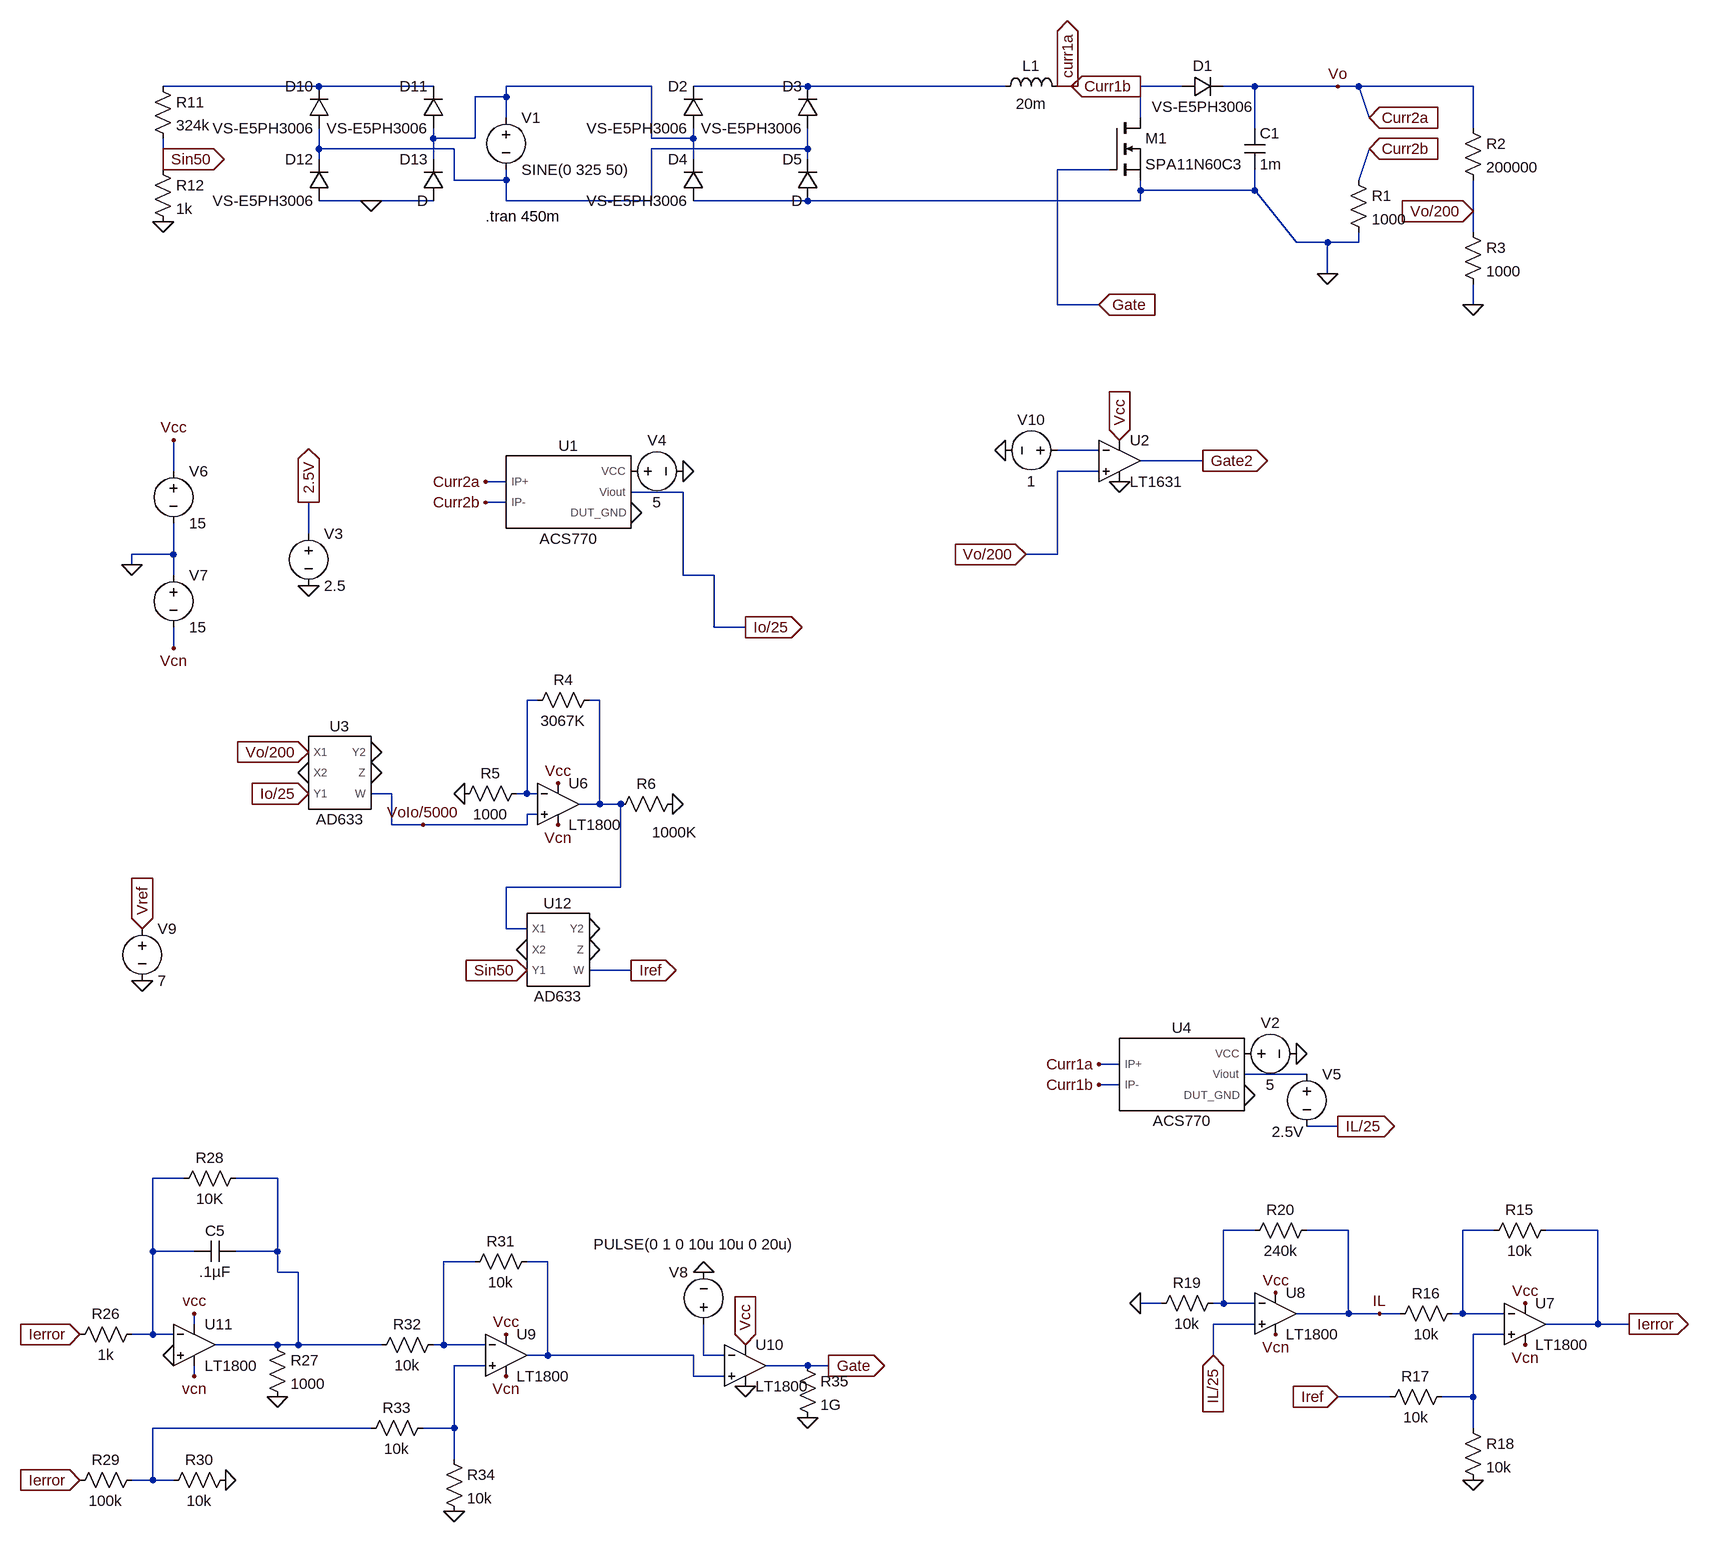
[diagram p0: schematic 6% THD Only current loop.asc]
6% THD Only current loop.asc, the LTspice schematic file:
Version 4.1
SHEET 1 2864 3240
WIRE -672 80 -912 80
WIRE -496 80 -672 80
WIRE -160 80 -384 80
WIRE 80 80 -96 80
WIRE 384 80 80 80
WIRE 480 80 464 80
WIRE 496 80 480 80
WIRE 656 80 592 80
WIRE 768 80 720 80
WIRE 896 80 768 80
WIRE 928 80 896 80
WIRE 1104 80 928 80
WIRE -384 96 -384 80
WIRE -384 96 -432 96
WIRE -384 128 -384 96
WIRE 592 128 592 80
WIRE 944 128 928 80
WIRE 768 144 768 80
WIRE 1104 144 1104 80
WIRE -496 160 -496 144
WIRE -432 160 -432 96
WIRE -432 160 -496 160
WIRE -160 160 -160 80
WIRE -96 160 -96 144
WIRE -96 160 -160 160
WIRE -672 176 -672 144
WIRE -464 176 -672 176
WIRE 80 176 80 144
WIRE 80 176 -160 176
WIRE -912 192 -912 160
WIRE -672 192 -672 176
WIRE -496 192 -496 160
WIRE -96 192 -96 160
WIRE 80 192 80 176
WIRE -912 208 -912 192
WIRE 544 208 464 208
WIRE -464 224 -464 176
WIRE -384 224 -384 208
WIRE -384 224 -464 224
WIRE 928 224 944 176
WIRE 592 240 592 224
WIRE 768 240 768 208
WIRE 768 240 592 240
WIRE -592 256 -672 256
WIRE -496 256 -592 256
WIRE -384 256 -384 224
WIRE -160 256 -160 176
WIRE -160 256 -384 256
WIRE 80 256 -96 256
WIRE 592 256 592 240
WIRE 592 256 80 256
WIRE 1104 272 1104 224
WIRE 1104 304 1104 272
WIRE 832 320 768 240
WIRE 880 320 832 320
WIRE 928 320 928 304
WIRE 928 320 880 320
WIRE 880 368 880 320
WIRE 464 416 464 208
WIRE 528 416 464 416
WIRE 1104 416 1104 384
WIRE 528 640 464 640
WIRE 688 656 592 656
WIRE -896 672 -896 624
WIRE 528 672 464 672
WIRE -384 688 -416 688
WIRE -112 704 -192 704
WIRE -384 720 -416 720
WIRE -688 768 -688 720
WIRE -896 800 -896 752
WIRE -896 800 -960 800
WIRE 464 800 464 672
WIRE 464 800 416 800
WIRE -960 816 -960 800
WIRE -896 832 -896 800
WIRE -112 832 -112 704
WIRE -64 832 -112 832
WIRE -64 912 -64 832
WIRE -16 912 -64 912
WIRE -896 944 -896 912
WIRE -336 1024 -352 1024
WIRE -240 1024 -256 1024
WIRE -560 1168 -592 1168
WIRE -352 1168 -352 1024
WIRE -352 1168 -368 1168
WIRE -336 1168 -352 1168
WIRE -240 1184 -240 1024
WIRE -240 1184 -272 1184
WIRE -208 1184 -240 1184
WIRE -336 1200 -352 1200
WIRE -560 1216 -560 1168
WIRE -512 1216 -560 1216
WIRE -352 1216 -352 1200
WIRE -352 1216 -512 1216
WIRE -208 1312 -208 1184
WIRE -208 1312 -384 1312
WIRE -384 1376 -384 1312
WIRE -352 1376 -384 1376
WIRE -192 1440 -256 1440
WIRE 560 1584 528 1584
WIRE 848 1600 752 1600
WIRE 560 1616 528 1616
WIRE 896 1680 848 1680
WIRE -880 1760 -928 1760
WIRE -736 1760 -800 1760
WIRE 768 1840 720 1840
WIRE 912 1840 848 1840
WIRE 1136 1840 1088 1840
WIRE 1296 1840 1216 1840
WIRE -928 1872 -928 1760
WIRE -864 1872 -928 1872
WIRE -736 1872 -736 1760
WIRE -736 1872 -800 1872
WIRE -432 1888 -480 1888
WIRE -320 1888 -352 1888
WIRE -736 1904 -736 1872
WIRE -704 1904 -736 1904
WIRE 624 1952 592 1952
WIRE 720 1952 720 1840
WIRE 720 1952 704 1952
WIRE 768 1952 720 1952
WIRE 912 1968 912 1840
WIRE 912 1968 832 1968
WIRE 960 1968 912 1968
WIRE 992 1968 960 1968
WIRE 1088 1968 1088 1840
WIRE 1088 1968 1072 1968
WIRE 1152 1968 1088 1968
WIRE -864 1984 -864 1968
WIRE 768 1984 704 1984
WIRE 1296 1984 1296 1840
WIRE 1296 1984 1216 1984
WIRE 1344 1984 1296 1984
WIRE -928 2000 -928 1872
WIRE -928 2000 -960 2000
WIRE -896 2000 -928 2000
WIRE 1152 2000 1104 2000
WIRE -736 2016 -832 2016
WIRE -704 2016 -704 1904
WIRE -704 2016 -736 2016
WIRE -576 2016 -704 2016
WIRE -480 2016 -480 1888
WIRE -480 2016 -496 2016
WIRE -416 2016 -480 2016
WIRE -320 2032 -320 1888
WIRE -320 2032 -352 2032
WIRE -96 2032 -320 2032
WIRE -80 2032 -80 1984
WIRE -48 2032 -80 2032
WIRE 704 2032 704 1984
WIRE -416 2048 -464 2048
WIRE 80 2048 16 2048
WIRE 112 2048 80 2048
WIRE -864 2064 -864 2048
WIRE -96 2064 -96 2032
WIRE -48 2064 -96 2064
WIRE 976 2096 896 2096
WIRE 1104 2096 1104 2000
WIRE 1104 2096 1056 2096
WIRE -592 2144 -928 2144
WIRE -464 2144 -464 2048
WIRE -464 2144 -512 2144
WIRE 1104 2144 1104 2096
WIRE -464 2192 -464 2144
WIRE -928 2224 -928 2144
WIRE -928 2224 -960 2224
WIRE -896 2224 -928 2224
FLAG 1104 416 0
FLAG 1104 272 Vo/200
IOPIN 1104 272 In
FLAG 896 80 Vo
FLAG 480 80 curr1a
IOPIN 480 80 Out
FLAG 592 80 Curr1b
IOPIN 592 80 Out
FLAG 528 1584 Curr1a
FLAG 528 1616 Curr1b
FLAG 832 1568 0
FLAG 752 1632 0
FLAG -416 688 Curr2a
FLAG -416 720 Curr2b
FLAG -112 672 0
FLAG -192 736 0
FLAG 944 128 Curr2a
IOPIN 944 128 In
FLAG 944 176 Curr2b
IOPIN 944 176 In
FLAG -896 944 Vcn
FLAG -896 624 Vcc
FLAG -960 816 0
FLAG 1104 2224 0
FLAG 1184 1952 Vcc
FLAG 1184 2016 Vcn
FLAG 800 1936 Vcc
FLAG 800 2000 Vcn
FLAG 704 2032 IL/25
IOPIN 704 2032 In
FLAG 592 1952 0
FLAG 896 2096 Iref
IOPIN 896 2096 In
FLAG 960 1968 IL
FLAG 1344 1984 Ierror
IOPIN 1344 1984 Out
FLAG -864 1968 vcc
FLAG -864 2064 vcn
FLAG -896 2032 0
FLAG -736 2096 0
FLAG -1040 2000 Ierror
IOPIN -1040 2000 In
FLAG -1040 2224 Ierror
IOPIN -1040 2224 In
FLAG -816 2224 0
FLAG -464 2272 0
FLAG -384 2000 Vcc
FLAG -384 2064 Vcn
FLAG -80 1904 0
FLAG -16 2080 0
FLAG -16 2016 Vcc
IOPIN -16 2016 In
FLAG 112 2048 Gate
IOPIN 112 2048 Out
FLAG 80 2128 0
FLAG 528 416 Gate
IOPIN 528 416 In
FLAG -912 288 0
FLAG -912 192 Sin50
IOPIN -912 192 Out
FLAG -592 256 0
FLAG -688 848 0
FLAG -688 720 2.5V
IOPIN -688 720 Out
FLAG 896 1680 IL/25
IOPIN 896 1680 Out
FLAG -16 912 Io/25
IOPIN -16 912 Out
FLAG -688 1104 Vo/200
IOPIN -688 1104 In
FLAG -688 1168 Io/25
IOPIN -688 1168 In
FLAG -352 1440 Sin50
IOPIN -352 1440 In
FLAG -688 1136 0
FLAG -592 1104 0
FLAG -592 1136 0
FLAG -352 1408 0
FLAG -256 1408 0
FLAG -256 1376 0
FLAG 560 624 Vcc
IOPIN 560 624 In
FLAG -448 1168 0
FLAG -128 1184 0
FLAG -512 1216 VoIo/5000
FLAG -192 1440 Iref
IOPIN -192 1440 Out
FLAG -944 1456 0
FLAG -944 1376 Vref
IOPIN -944 1376 In
FLAG 560 688 0
FLAG 384 640 0
FLAG 416 800 Vo/200
IOPIN 416 800 In
FLAG 880 368 0
FLAG 688 656 Gate2
IOPIN 688 656 Out
FLAG -304 1152 Vcc
FLAG -304 1216 Vcn
SYMBOL ind 368 96 R270
WINDOW 0 32 56 VTop 2
WINDOW 3 5 56 VBottom 2
SYMATTR InstName L1
SYMATTR Value 20m
SYMBOL cap 752 144 R0
SYMATTR InstName C1
SYMATTR Value 1m
SYMBOL nmos 544 128 R0
SYMATTR InstName M1
SYMATTR Value SPA11N60C3
SYMBOL res 912 208 R0
SYMATTR InstName R1
SYMATTR Value 1000
SYMBOL diode 656 96 R270
WINDOW 0 32 32 VTop 2
WINDOW 3 0 32 VBottom 2
SYMATTR InstName D1
SYMATTR Value VS-E5PH3006
SYMBOL diode -80 144 R180
WINDOW 0 24 64 Left 2
WINDOW 3 24 0 Left 2
SYMATTR InstName D2
SYMATTR Value VS-E5PH3006
SYMBOL diode 96 144 R180
WINDOW 0 24 64 Left 2
WINDOW 3 24 0 Left 2
SYMATTR InstName D3
SYMATTR Value VS-E5PH3006
SYMBOL diode -80 256 R180
WINDOW 0 24 64 Left 2
WINDOW 3 24 0 Left 2
SYMATTR InstName D4
SYMATTR Value VS-E5PH3006
SYMBOL diode 96 256 R180
WINDOW 0 24 64 Left 2
WINDOW 3 24 0 Left 2
SYMATTR InstName D5
SYMBOL voltage -384 112 R0
WINDOW 123 0 0 Left 0
WINDOW 39 0 0 Left 0
SYMATTR InstName V1
SYMATTR Value SINE(0 325 50)
SYMBOL res 1088 128 R0
SYMATTR InstName R2
SYMATTR Value 200000
SYMBOL res 1088 288 R0
SYMATTR InstName R3
SYMATTR Value 1000
SYMBOL voltage 736 1568 R270
WINDOW 0 32 56 VTop 2
WINDOW 3 -32 56 VBottom 2
SYMATTR InstName V2
SYMATTR Value 5
SYMBOL voltage -208 672 R270
WINDOW 0 32 56 VTop 2
WINDOW 3 -32 56 VBottom 2
SYMATTR InstName V4
SYMATTR Value 5
SYMBOL voltage -896 656 R0
SYMATTR InstName V6
SYMATTR Value 15
SYMBOL voltage -896 816 R0
SYMATTR InstName V7
SYMATTR Value 15
SYMBOL res 1232 1824 R90
WINDOW 0 0 56 VBottom 2
WINDOW 3 32 56 VTop 2
SYMATTR InstName R15
SYMATTR Value 10k
SYMBOL res 976 1984 R270
WINDOW 0 32 56 VTop 2
WINDOW 3 0 56 VBottom 2
SYMATTR InstName R16
SYMATTR Value 10k
SYMBOL res 960 2112 R270
WINDOW 0 32 56 VTop 2
WINDOW 3 0 56 VBottom 2
SYMATTR InstName R17
SYMATTR Value 10k
SYMBOL res 1088 2128 R0
SYMATTR InstName R18
SYMATTR Value 10k
SYMBOL res 720 1936 R90
WINDOW 0 0 56 VBottom 2
WINDOW 3 32 56 VTop 2
SYMATTR InstName R19
SYMATTR Value 10k
SYMBOL res 864 1824 R90
WINDOW 0 0 56 VBottom 2
WINDOW 3 32 56 VTop 2
SYMATTR InstName R20
SYMATTR Value 240k
SYMBOL res -944 1984 R90
WINDOW 0 0 56 VBottom 2
WINDOW 3 32 56 VTop 2
SYMATTR InstName R26
SYMATTR Value 1k
SYMBOL res -752 2000 R0
SYMATTR InstName R27
SYMATTR Value 1000
SYMBOL cap -800 1856 R90
WINDOW 0 0 32 VBottom 2
WINDOW 3 32 32 VTop 2
SYMATTR InstName C5
SYMATTR Value .1µF
SYMBOL res -784 1744 R90
WINDOW 0 0 56 VBottom 2
WINDOW 3 32 56 VTop 2
SYMATTR InstName R28
SYMATTR Value 10K
SYMBOL res -944 2208 R90
WINDOW 0 0 56 VBottom 2
WINDOW 3 32 56 VTop 2
SYMATTR InstName R29
SYMATTR Value 100k
SYMBOL res -800 2208 R90
WINDOW 0 0 56 VBottom 2
WINDOW 3 32 56 VTop 2
SYMATTR InstName R30
SYMATTR Value 10k
SYMBOL res -336 1872 R90
WINDOW 0 0 56 VBottom 2
WINDOW 3 32 56 VTop 2
SYMATTR InstName R31
SYMATTR Value 10k
SYMBOL res -592 2032 R270
WINDOW 0 32 56 VTop 2
WINDOW 3 0 56 VBottom 2
SYMATTR InstName R32
SYMATTR Value 10k
SYMBOL res -608 2160 R270
WINDOW 0 32 56 VTop 2
WINDOW 3 0 56 VBottom 2
SYMATTR InstName R33
SYMATTR Value 10k
SYMBOL res -480 2176 R0
SYMATTR InstName R34
SYMATTR Value 10k
SYMBOL voltage -80 2000 R180
WINDOW 0 24 96 Left 2
WINDOW 3 -141 139 Left 2
WINDOW 123 0 0 Left 0
WINDOW 39 0 0 Left 0
SYMATTR InstName V8
SYMATTR Value PULSE(0 1 0 10u 10u 0 20u)
SYMBOL res 64 2032 R0
SYMATTR InstName R35
SYMATTR Value 1G
SYMBOL diode -656 144 R180
WINDOW 0 24 64 Left 2
WINDOW 3 24 0 Left 2
SYMATTR InstName D10
SYMATTR Value VS-E5PH3006
SYMBOL diode -480 144 R180
WINDOW 0 24 64 Left 2
WINDOW 3 24 0 Left 2
SYMATTR InstName D11
SYMATTR Value VS-E5PH3006
SYMBOL diode -656 256 R180
WINDOW 0 24 64 Left 2
WINDOW 3 24 0 Left 2
SYMATTR InstName D12
SYMATTR Value VS-E5PH3006
SYMBOL diode -480 256 R180
WINDOW 0 24 64 Left 2
WINDOW 3 24 0 Left 2
SYMATTR InstName D13
SYMBOL res -928 64 R0
SYMATTR InstName R11
SYMATTR Value 324k
SYMBOL res -928 192 R0
SYMATTR InstName R12
SYMATTR Value 1k
SYMBOL voltage -688 752 R0
SYMATTR InstName V3
SYMATTR Value 2.5
SYMBOL OpAmps\\LT1800 -16 1984 R0
SYMATTR InstName U10
SYMBOL OpAmps\\LT1800 1184 1920 R0
SYMATTR InstName U7
SYMBOL OpAmps\\LT1800 800 1904 R0
SYMATTR InstName U8
SYMBOL OpAmps\\LT1800 -384 1968 R0
SYMATTR InstName U9
SYMBOL OpAmps\\LT1800 -864 1952 R0
SYMATTR InstName U11
SYMBOL voltage 848 1584 R0
WINDOW 3 -54 104 Left 2
SYMATTR Value 2.5V
SYMATTR InstName V5
SYMBOL OpAmps\\LT1631 560 592 R0
SYMATTR InstName U2
SYMBOL res -240 1008 R90
WINDOW 0 0 56 VBottom 2
WINDOW 3 32 56 VTop 2
SYMATTR InstName R4
SYMATTR Value 3067K
SYMBOL res -352 1152 R90
WINDOW 0 0 56 VBottom 2
WINDOW 3 32 56 VTop 2
SYMATTR InstName R5
SYMATTR Value 1000
SYMBOL res -112 1168 R90
WINDOW 0 0 56 VBottom 2
WINDOW 3 44 13 VTop 2
SYMATTR InstName R6
SYMATTR Value 1000K
SYMBOL voltage -944 1360 R0
SYMATTR InstName V9
SYMATTR Value 7
SYMBOL voltage 480 640 R90
WINDOW 0 -32 56 VBottom 2
WINDOW 3 32 56 VTop 2
WINDOW 123 0 0 Left 0
WINDOW 39 0 0 Left 0
SYMATTR InstName V10
SYMATTR Value 1
SYMBOL OpAmps\\LT1800 -304 1120 R0
SYMATTR InstName U6
SYMBOL ADM -640 1136 R0
SYMATTR InstName U3
SYMBOL ADM -304 1408 R0
SYMATTR InstName U12
SYMBOL ACS770 -288 704 R0
SYMATTR InstName U1
SYMBOL ACS770 656 1600 R0
SYMATTR InstName U4
TEXT -416 280 Left 2 !.tran 450m

The netlist it stands for:
* 6% THD Only current loop.asc
L1 N003 curr1a 20m
C1 Curr2a 0 1m
M1 Curr1b Gate 0 0 SPA11N60C3
R1 Curr2b 0 1000
D1 Curr1b Curr2a VS-E5PH3006
D2 N002 N003 VS-E5PH3006
D3 N004 N003 VS-E5PH3006
D4 0 N002 VS-E5PH3006
D5 0 N004 D
V1 N002 N004 SINE(0 325 50)
R2 Curr2a Vo/200 200000
R3 Vo/200 0 1000
V2 P001 0 5
V4 P002 0 5
V6 Vcc 0 15
V7 0 Vcn 15
R15 Ierror N012 10k
R16 IL N012 10k
R17 Iref N015 10k
R18 N015 0 10k
R19 N011 0 10k
R20 IL N011 240k
R26 N009 Ierror 1k
R27 N010 0 1000
C5 N010 N009 .1µF
R28 N010 N009 10K
R29 N018 Ierror 100k
R30 0 N018 10k
R31 N014 N013 10k
R32 N010 N013 10k
R33 N018 N017 10k
R34 N017 0 10k
V8 N016 0 PULSE(0 1 0 10u 10u 0 20u)
R35 Gate 0 1G
D10 N004 N001 VS-E5PH3006
D11 N002 N001 VS-E5PH3006
D12 0 N004 VS-E5PH3006
D13 0 N002 D
R11 N001 Sin50 324k
R12 Sin50 0 1k
V3 2.5V 0 2.5
X§U10 N014 N016 Vcc 0 Gate LT1800  ; pins In+ In- V+ V- OUT
X§U7 N015 N012 Vcc Vcn Ierror LT1800  ; pins In+ In- V+ V- OUT
X§U8 IL/25 N011 Vcc Vcn IL LT1800  ; pins In+ In- V+ V- OUT
X§U9 N017 N013 Vcc Vcn N014 LT1800  ; pins In+ In- V+ V- OUT
X§U11 0 N009 Vcc Vcn N010 LT1800  ; pins In+ In- V+ V- OUT
V5 N008 IL/25 2.5V
X§U2 Vo/200 N005 Vcc 0 Gate2 LT1630  ; LT1631, pins In+ In- V+ V- OUT
R4 N007 N006 3067K
R5 N006 0 1000
R6 0 N007 1000K
V9 Vref 0 7
V10 N005 0 1
X§U6 VoIo/5000 N006 Vcc Vcn N007 LT1800  ; pins In+ In- V+ V- OUT
X§U3 Vo/200 0 Io/25 0 0 VoIo/5000 AD633  ; pins X1 X2 Y1 Y2 Z W
X§U12 N007 0 Sin50 0 0 Iref AD633  ; pins X1 X2 Y1 Y2 Z W
X§U1 Curr2a Curr2b P002 Io/25 0 ACS770  ; pins IP+ IP- VCC Viout DUT_GND
X§U4 curr1a Curr1b P001 N008 0 ACS770  ; pins IP+ IP- VCC Viout DUT_GND
.model D D
.lib standard.dio
.model NMOS NMOS
.model PMOS PMOS
.lib standard.mos
.tran 450m
.lib LTC.lib
.lib C:\Users\Vinayaka\OneDrive\Desktop\PFC circuit\files\ad633 ideal.cir
.lib C:\Users\Vinayaka\OneDrive\Desktop\PFC circuit\files\ACS770.lib
.backanno
.end